# Altium schematic sheet LED_Schematic.SchDoc
size A4; SheetNumber: 1; SheetTotal: 1
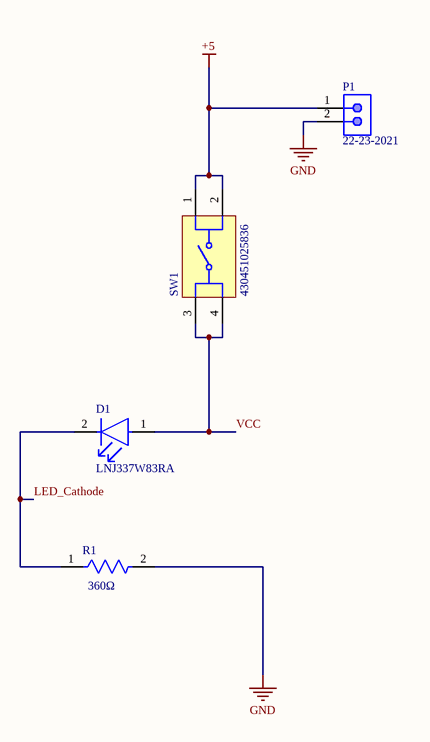
[diagram p0: LED_Schematic.SchDoc]

## Parts
D1  LNJ337W83RA  [FP-LNJ337W83RA-MFG]
P1  22-23-2021  [MOLX-22-23-2021_V]
R1  360Ω  [FP-CRCW0805-e3-MFG]
SW1  430451025836  [430451025836]

## Nets
+5: P1.1 SW1.1 SW1.2
GND: P1.2 R1.2
LED_Cathode: D1.2(C) R1.1
VCC: D1.1(A) SW1.3 SW1.4

## Library data of the parts
D1 = CMP-05535-000002-1: LED GREEN ESS II SMD; Obsolete Part: true; Manufacturer: Panasonic; Peak Emmision Wavelength: 575nm; Wavelength: 572nm; Reverse Voltage: 4V; Forward Current: 5mA; Description: Green 572nm LED Indication - Discrete 1.95V 0603 (1608 Metric); Forward Voltage: 1.95V; Luminous Intensity: 7.5mcd; Led Orientation: Top View; Power Dissipation: 55mW; Automotive: No; Mouser Description: LNJ337W83RA; ESS II Series Yellow-Green LED; 572 nm 1608(0603); Rectangle Lens; Temperature: -30°C to +85°C; Category: Diode; Temperature Range High: +85°C; Colour: Green; Height: 0.25mm; Device Class L2: LEDs; Device Class L3: unset; ComponentLink2Description: Datasheet; RoHS: TRUE; Package: LNJ337W83RA; Digikey Description: LED GREEN ESS II SMD; Lead Free: Yes; Ambient Temperature Range High: +85°C; ComponentLink2URL: https://industrial.panasonic.com/content/data/SC/ds/ds4/LNJ337W83RA_E.pdf; Temperature Range Low: -30°C; Manufacturer Part Number: LNJ337W83RA; Octopart: https://octopart.com/lnj337w83ra-panasonic-44404387; Ambient Temperature Range Low: -30°C; Device Class L1: Optoelectronics
P1 = CMP-1704-00001-3: Male Header, Pitch 2.54 mm, 1 x 2 Position, Height 10.67 mm, Tail Length 3.56 mm, 0 to 75 degC, RoHS, Bulk; Package Quantity: 3000; Height: 10.67 mm; RoHSCompliant: True; ComponentLink2URL: https://datasheet.ciiva.com/19454/232266-19454304.pdf; PartNumber: 22-23-2021; Packaging: Bulk; ComponentLink2Description: Datasheet; Min Operating Temperature: 0 degC; ComponentLink1Description: Manufacturer URL; Length: 5.08 mm; Mounting Technology: Through Hole; Max Operating Temperature: 75 degC; REACH SVHC: Unknown; PackageDescription: Male Header, Pitch 2.54 mm, 1 x 2 Position, Height 10.67 mm, Tail Length 3.56 mm; ComponentLink1URL: http://www.molex.com/; Mount: Through Hole; Radiation Hardening: No; Width: 6.35 mm; Pins: 2
R1 = CMP-2001-03843-2: RES Thick Film, 360Ω, 1%, 0.125W, 100ppm/°C, 0805; Resistance: 360R; Max Power Dissipation: 125mW; Voltage Rating (DC): 150V; Max Operating Temperature: 155°C; Min Operating Temperature: -55°C; Military Standard: Not; Packaging: Tape and Reel; Contact Plating: Tin; Weight: 0.000194oz; Depth: 1.25mm; Case/Package: 0805; Number of Pins: 2; Voltage Rating: 150V; Power Rating: 125mW; Tolerance: 1%; Features: Automotive AEC-Q200; Lead Free: Lead Free; Number of Terminations: 2; Height: 0.45mm; Termination: SMD/SMT; Length: 2mm; Composition: Thick Film; Package Quantity: 10; Radiation Hardening: No; Temperature Coefficient: 100ppm/°C; Number of Terminals: 2; Case Code (Metric): 2012; Case Code (Imperial): 0805; Width: 0.049inch
SW1 = CMP-1452-00019-7: Tactile Switch, 0.05A, 12Vdc, 360Gf, Smd Rohs Compliant: Yes; Manufacturer Lifecycle Status: ACTIVE; Illumination Type: Non-Illuminated; Switch Function: Off-Mom; Actuator Material: Liquid Crystal Polymer, Polymer; Throw Configuration: SPST; Insulation Resistance: 100MΩ; YEOL: 1 = Estimated lifetime > 10 years; Switch Travel: 250µm; Mechanical Life: 200kcycles; Voltage Rating: 12V; Current Rating: 50mA; RoHS: Compliant; Packaging: Tape and Reel; Min Operating Temperature: -40°C; Lifecycle Status: Production; Contact Plating: Silver; Max Operating Temperature: 85°C; Height: 2.5mm; Mount: Surface Mount; Termination: SMD/SMT